# Altium schematic sheet Title.SchDoc: =DT_SCH_Title
size A4; Organization: Droid Technologies; SheetNumber: 1; SheetTotal: 22
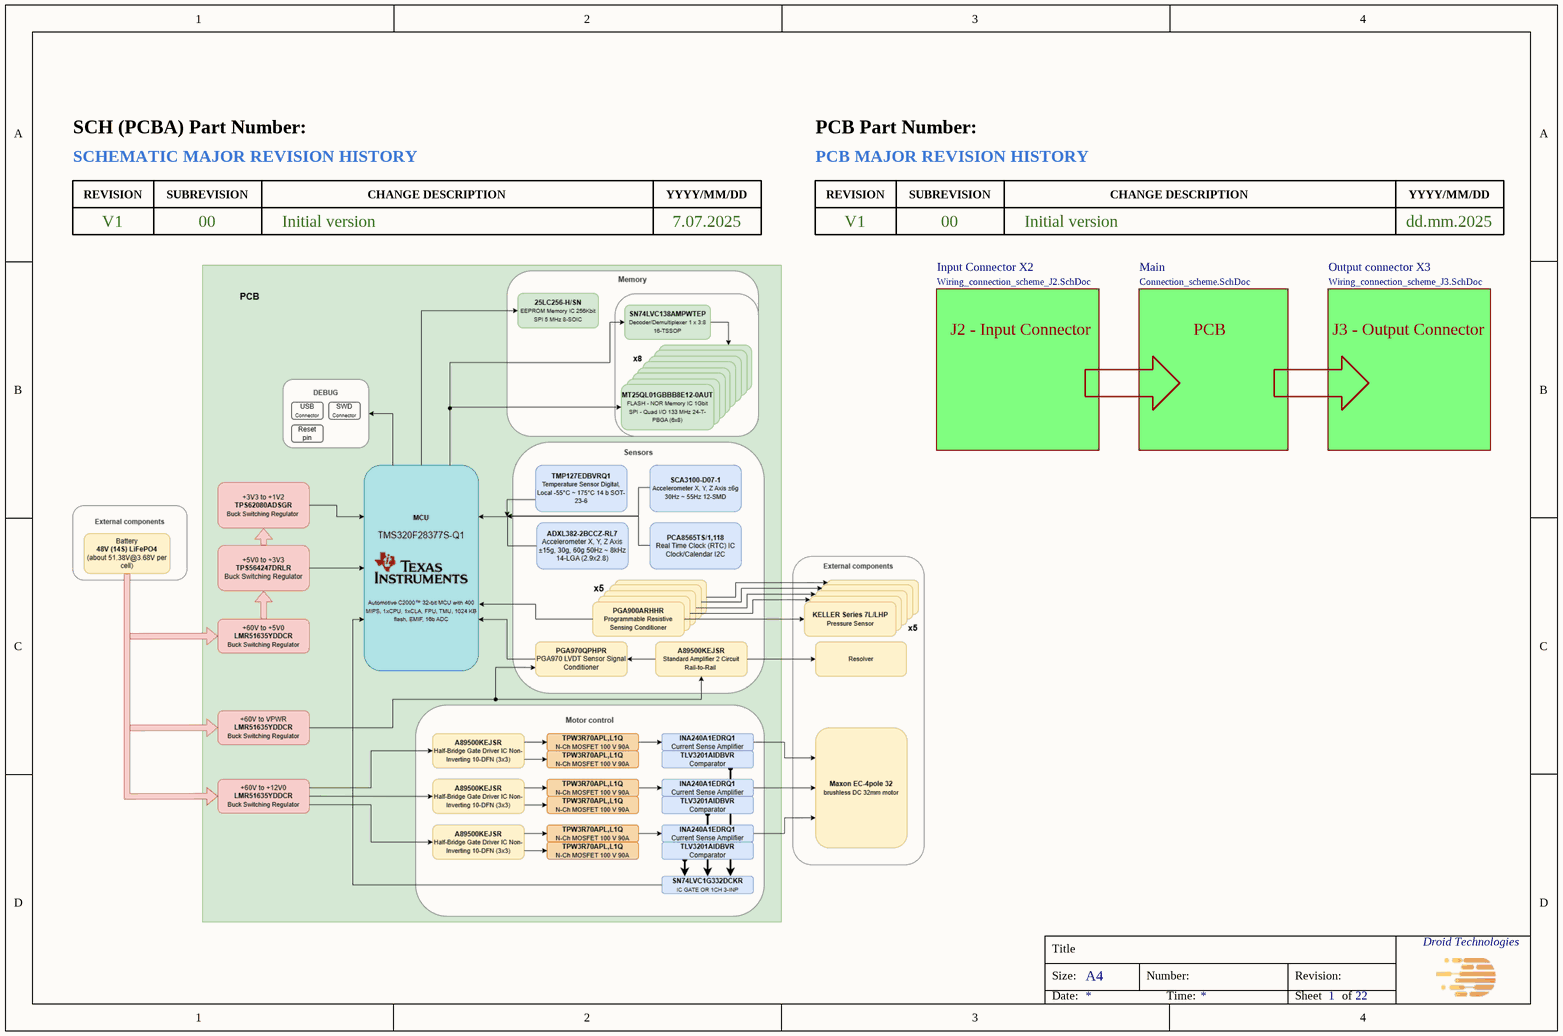
[diagram p0: Title.SchDoc]

## Sub-sheets
Input Connector X2 = Wiring_connection_scheme_J2.SchDoc: no entries
Main = Connection_scheme.SchDoc: no entries
Output connector X3 = Wiring_connection_scheme_J3.SchDoc: no entries

## Notes on the sheet
- V1
- 00
- Initial version
- 7.07.2025
- dd.mm.2025
- J2 - Input Connector
- PCB
- J3 - Output Connector
- SCHEMATIC MAJOR REVISION HISTORY
- SCH (PCBA) Part Number:
- PCB MAJOR REVISION HISTORY
- PCB Part Number:
- REVISION
- SUBREVISION
- CHANGE DESCRIPTION
- YYYY/MM/DD
- Title
- Size:
- A4
- Number:
- Revision:
- Date:
- Time:
- Sheet
- of